# Altium project CountsFitness.PrjPCB (part 3 of 3)

## Sheet Connector_Section.SchDoc
size A4; DocumentNumber: 6; SheetNumber: 6; SheetTotal: 6
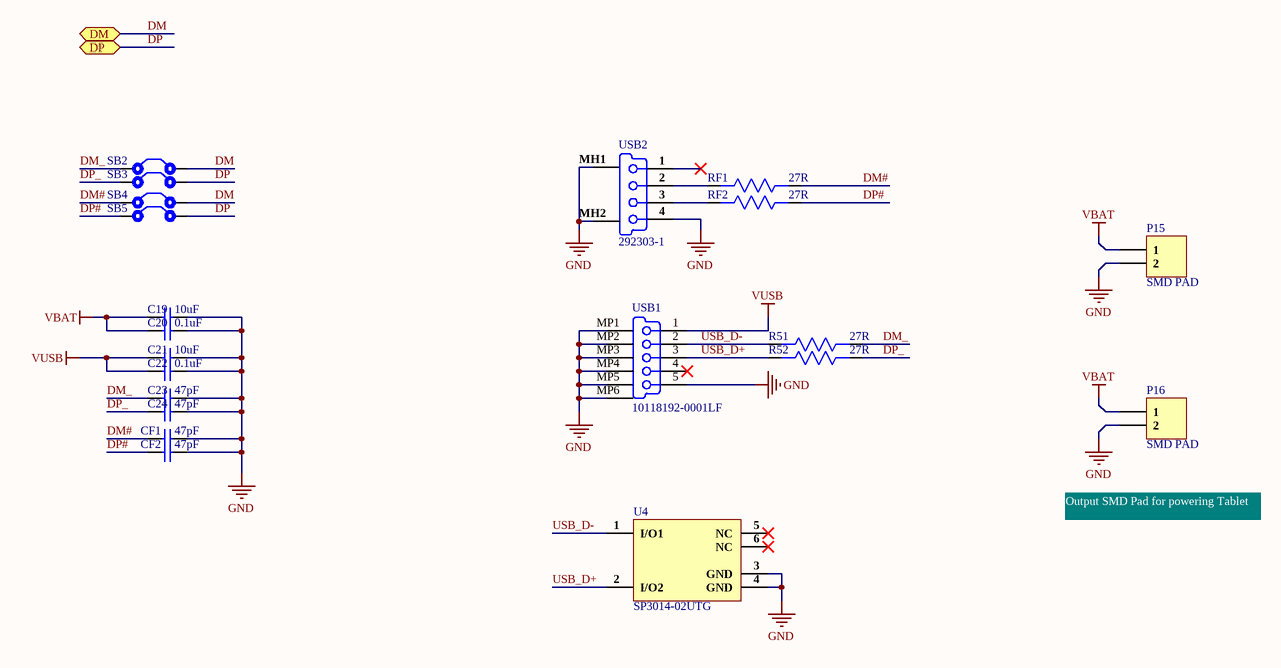
[diagram p4: Connector_Section.SchDoc]

### Parts
C19  10uF  [Cap0402]
C20  0.1uF  [Cap0402]
C21  10uF  [Cap0402]
C22  0.1uF  [Cap0402]
C23  47pF  [Cap0402]
C24  47pF  [Cap0402]
CF1  47pF  [Cap0402]
CF2  47pF  [Cap0402]
P15  SMD PAD  [Solder Bridge]
P16  SMD PAD  [Solder Bridge]
R51  27R  [Res0402]
R52  27R  [Res0402]
RF1  27R  [Res0402]
RF2  27R  [Res0402]
SB2  Solder Bridge  [Solder Bridge]  (value not drawn)
SB3  Solder Bridge  [Solder Bridge]  (value not drawn)
SB4  Solder Bridge  [Solder Bridge]  (value not drawn)
SB5  Solder Bridge  [Solder Bridge]  (value not drawn)
U4  SP3014-02UTG  [SP3014-02UTG]
USB1  10118192-0001LF  [Micro Usb Conn SMD]
USB2  292303-1  [292303-1]

### Ports
DM (bidir), DP (bidir)

### Nets
GND: C19.2 C20.2 C21.2 C22.2 C23.2 C24.2 CF1.2 CF2.2 P15.2 P16.2 U4.3(GND) U4.4(GND) USB1.5(GND) USB1.MP1(Tab) USB1.MP2(Tab) USB1.MP3(Tab) USB1.MP4(Tab) USB1.MP5(Tab) USB1.MP6(Tab) USB2.4(NC) USB2.MH1(Tab) USB2.MH2(Tab)
VBAT: C19.1 C20.1 P15.1 P16.1
VUSB: C21.1 C22.1 USB1.1(V_BUS_(5V))
DM: SB2.2 SB4.2 ; port DM
DM#: CF1.1 RF1.1 SB4.1
DM_: C23.1 R51.1 SB2.1
DP: SB3.2 SB5.2 ; port DP
DP#: CF2.1 RF2.1 SB5.1
DP_: C24.1 R52.1 SB3.1
USB_D+: R52.2 U4.2(I/O2) USB1.3(D+)
USB_D-: R51.2 U4.1(I/O1) USB1.2(D-)
NetRF1_2: RF1.2 USB2.2(D-)
NetRF2_2: RF2.2 USB2.3(D+)

Not connected (* = marked no-connect by the designer): U4 5(NC)* 6(NC)*; USB1 4(NC)*; USB2 1(V_BUS_(5V))*

### Notes on the sheet
- Output SMD Pad for powering Tablet

### Library data of the parts
C19 C21 = CL05A106MP8NUB8: CAP CER 10UF 10V X5R 0402; Manufacturer: Samsung; Tolerance: 20%; Supplier 1: Digi-Key; Manufacturer Part Number: CL05A106MP8NUB8; Stock 1: 1792112; Pricing 1: 1=0.4, 10=0.278, 50=0.1948, 100=0.167, 500=0.12528, 1000=0.1058, 2500=0.10023 (USD); Mount: Surface Mount; Case/Package: 0402; Case Code (Metric): 1005; Case Code (Imperial): 0402; Min Operating Temperature: -55°C; Max Operating Temperature: 85°C; Packaging: Tape and Reel; Capacitance: 10uF; Voltage Rating: 10V; Length: 0.039inch; Width: 0.02inch; Thickness: 0.035inch; ComponentLink1URL: http://www.samsungsem.com/kr/support/product-search/mlcc/CL05A106MP8NUB8.jsp?src-supplier=Digi-Key; ComponentLink1Description: http://www.samsungsem.com/kr/support/product-search/mlcc/CL05A106MP8NUB8.jsp?src-supplier=Digi-Key; Supplier Part Number 1: 1276-6830-1-ND
C20 C22 = CC0402KRX7R7BB104: CAP CER 0.1UF 16V X7R 0402; Manufacturer: Yageo; Tolerance: 10%; Capacitance: 100nF; Supplier 1: Digi-Key; Manufacturer Part Number: CC0402KRX7R7BB104; Stock 1: 16982736; Pricing 1: 1=0.1, 10=0.034, 100=0.015, 500=0.0107, 1000=0.00841, 2500=0.00764, 5000=0.00703 (USD); Mount: Surface Mount; Case/Package: 0402; Number of Pins: 2; Case Code (Metric): 1005; Case Code (Imperial): 0402; Min Operating Temperature: -55°C; Max Operating Temperature: 125°C; Dielectric: X7R; Voltage Rating: 16V; Voltage Rating (DC): 16V; Packaging: Tape and Reel; Package Quantity: 1; Termination: SMD/SMT; Composition: Ceramic; Voltage: 16V; Length: 1mm; Height: 0.5mm; Width: 0.02inch; Thickness: 0.022inch; Depth: 0.5mm; Radiation Hardening: No; REACH SVHC: No SVHC; Lead Free: Lead Free; Halogen Free: Halogen Free; ComponentLink1URL: http://www.yageo.com/documents/recent/UPY-GPHC_X7R_6.3V-to-50V_8.pdf?src-supplier=Avnet+Europe; ComponentLink1Description: http://www.yageo.com/documents/recent/UPY-GPHC_X7R_6.3V-to-50V_8.pdf?src-supplier=Avnet+Europe; ComponentLink2URL: http://www.yageo.com/documents/recent/UPY-GPHC_X7R_6.3V-to-50V_18.pdf?src-supplier=Digi-Key; ComponentLink2Description: http://www.yageo.com/documents/recent/UPY-GPHC_X7R_6.3V-to-50V_18.pdf?src-supplier=Digi-Key; ComponentLink3URL: http://www.yageo.com/documents/recent/UPY-GPHC_X7R_6.3V-to-50V_8.pdf?src-supplier=Avnet; ComponentLink3Description: http://www.yageo.com/documents/recent/UPY-GPHC_X7R_6.3V-to-50V_8.pdf?src-supplier=Avnet; ComponentLink4URL: http://www.yageo.com/documents/recent/UPY-GPHC_X7R_6.3V-to-50V_18.pdf?src-supplier=Mouser; ComponentLink4Description: http://www.yageo.com/documents/recent/UPY-GPHC_X7R_6.3V-to-50V_18.pdf?src-supplier=Mouser; ComponentLink5URL: http://www.farnell.com/datasheets/2167236.pdf?src-supplier=Element14; ComponentLink5Description: http://www.farnell.com/datasheets/2167236.pdf?src-supplier=Element14; ComponentLink6URL: http://www.farnell.com/datasheets/1489800.pdf?src-supplier=Element14; ComponentLink6Description: http://www.farnell.com/datasheets/1489800.pdf?src-supplier=Element14; Supplier Part Number 1: 311-1338-1-ND
C23 C24 CF1 CF2 = GCM1555C1H470JA16D: CAP CER 47PF 50V C0G/NP0 0402; Manufacturer: Murata; Tolerance: 5%; Supplier 1: Digi-Key; Manufacturer Part Number: GCM1555C1H470JA16D; Stock 1: 692165; Pricing 1: 1=0.1, 10=0.059, 50=0.0324, 100=0.0265, 500=0.01892, 1000=0.01487, 2500=0.01352, 5000=0.01244 (USD); Mount: Surface Mount; Case/Package: 0402; Case Code (Metric): 1005; Case Code (Imperial): 0402; Min Operating Temperature: -55°C; Max Operating Temperature: 125°C; Packaging: Cut Tape; Capacitance: 47pF; Voltage Rating: 50V; Length: 0.039inch; Width: 0.02inch; Thickness: 0.022inch; Ratings: AEC-Q200; Lead Free: Lead Free; ComponentLink1URL: https://www.murata.com/~/media/webrenewal/support/library/catalog/products/capacitor/mlcc/c03e.ashx?la=en-us&src-supplier=Digi-Key; ComponentLink1Description: https://www.murata.com/~/media/webrenewal/support/library/catalog/products/capacitor/mlcc/c03e.ashx?la=en-us&src-supplier=Digi-Key; ComponentLink2URL: http://www.mouser.com/ds/2/281/c03e-806517.pdf?src-supplier=Mouser; ComponentLink2Description: http://www.mouser.com/ds/2/281/c03e-806517.pdf?src-supplier=Mouser; ComponentLink3URL: http://psearch.en.murata.com/capacitor/product/GCM1555C1H470JA16%23.pdf?src-supplier=Avnet; ComponentLink3Description: http://psearch.en.murata.com/capacitor/product/GCM1555C1H470JA16%23.pdf?src-supplier=Avnet; Supplier Part Number 1: 490-10670-1-ND
P15 P16 = SMD PAD: Wire connecting Pads
R51 R52 RF1 RF2 = RT0402FRE0727RL: RES SMD 27 OHM 1% 1/16W 0402; Manufacturer: Yageo; Power Rating: 62.5mW; Voltage Rating: 50V; Max Power Dissipation: 63mW; Temperature Coefficient: 50ppm/°C; Supplier 1: Digi-Key; Manufacturer Part Number 1: RT0402FRE0727RL; Stock 1: 26946; Pricing 1: 1=0.1, 10=0.072, 100=0.0277, 1000=0.0122, 2500=0.0105, 5000=0.0094 (USD); Case/Package: 0402; Case Code (Metric): 1005; Case Code (Imperial): 0402; Min Operating Temperature: -55°C; Max Operating Temperature: 125°C; Resistance: 27R; Tolerance: 1%; Packaging: Tape and Reel; Package Quantity: 10000; Composition: Thin Film; Number of Terminations: 2; Termination: SMD/SMT; Military Standard: Not; Voltage Rating (DC): 50V; Features: Moisture Resistant; Length: 1mm; Height: 0.014inch; Width: 0.02inch; Depth: 0.5mm; Lead Free: Lead Free; ComponentLink1URL: http://www.yageo.com/NewPortal/yageodocoutput?fileName=/pdf/R-Chip/PYu-RT_1-to-0.05_RoHS_L_5.pdf&src-supplier=Digi-Key; ComponentLink1Description: http://www.yageo.com/NewPortal/yageodocoutput?fileName=/pdf/R-Chip/PYu-RT_1-to-0.05_RoHS_L_5.pdf&src-supplier=Digi-Key; ComponentLink2URL: http://www.mouser.com/ds/2/447/yageodocoutput-1125656.pdf?src-supplier=Mouser; ComponentLink2Description: http://www.mouser.com/ds/2/447/yageodocoutput-1125656.pdf?src-supplier=Mouser; Supplier Part Number 1: YAG3343CT-ND
SB2-SB5 = Solder Bridge: Solder Bridge ON
U4 = SP3014-02UTG: TVS DIODE 5V 6.8V 6UDFN; Manufacturer: Littelfuse; Capacitance: 1E-12F; Number of Bidirectional Channels: 2; Power Line Protection: Yes; Polarity: Unidirectional; Max Surge Current: 8A; Supplier 1: Digi-Key; Manufacturer Part Number: SP3014-02UTG; Stock 1: 3888; Pricing 1: 1=0.56, 10=0.495, 25=0.4652, 100=0.3375, 250=0.32552, 500=0.282, 1000=0.24 (USD); Mount: Surface Mount; Number of Pins: 6; Min Operating Temperature: -40°C; Max Operating Temperature: 125°C; Packaging: Tape and Reel; Reverse Standoff Voltage: 5V; Clamping Voltage: 6.8V; Termination: SMD/SMT; Number of Channels: 2; Working Voltage: 5V; Package Quantity: 3000; Peak Pulse Current: 8A; Length: 1.65mm; Height: 0.55mm; Width: 1.05mm; ComponentLink1URL: http://www.mouser.com/ds/2/240/Littelfuse_TVS_Diode_Array_SP3014_Datasheet.pdf-364113.pdf?src-supplier=Mouser; ComponentLink1Description: http://www.mouser.com/ds/2/240/Littelfuse_TVS_Diode_Array_SP3014_Datasheet.pdf-364113.pdf?src-supplier=Mouser; ComponentLink2URL: https://www.littelfuse.com/~/media/electronics/datasheets/tvs_diode_arrays/littelfuse_tvs_diode_array_sp3014_datasheet.pdf.pdf?src-supplier=Digi-Key; ComponentLink2Description: https://www.littelfuse.com/~/media/electronics/datasheets/tvs_diode_arrays/littelfuse_tvs_diode_array_sp3014_datasheet.pdf.pdf?src-supplier=Digi-Key; ComponentLink3URL: http://www.littelfuse.com/~/media/electronics/datasheets/tvs_diode_arrays/littelfuse_tvs_diode_array_sp3014_datasheet.pdf.pdf?src-supplier=Digi-Key; ComponentLink3Description: http://www.littelfuse.com/~/media/electronics/datasheets/tvs_diode_arrays/littelfuse_tvs_diode_array_sp3014_datasheet.pdf.pdf?src-supplier=Digi-Key; ComponentLink4URL: http://www.farnell.com/datasheets/2291833.pdf?src-supplier=Element14; ComponentLink4Description: http://www.farnell.com/datasheets/2291833.pdf?src-supplier=Element14; ComponentLink5URL: http://www.farnell.com/datasheets/2291833.pdf?src-supplier=Farnell; ComponentLink5Description: http://www.farnell.com/datasheets/2291833.pdf?src-supplier=Farnell; ComponentLink6URL: http://www.farnell.com/datasheets/2291833.pdf?src-supplier=Newark; ComponentLink6Description: http://www.farnell.com/datasheets/2291833.pdf?src-supplier=Newark; Supplier Part Number 1: F6501DKR-ND
USB1 = 10118192-0001LF: CONN USB MICRO B RECPT SMT R/A; Manufacturer: Amphenol FCI; Gender: Receptacle; Current Rating: 1.8A; Connector Type: USB,Receptacle; Number of Contacts: 5; Insulation Resistance: 1GR; Number of Ports: 1; Max Voltage Rating (AC): 100V; USB Standard: USB 2.0; Pitch: 0.65mm; Supplier 1: Digi-Key; Manufacturer Part Number: 10118192-0001LF; Stock 1: 203283; Pricing 1: 1=0.42, 10=0.393, 25=0.3536, 50=0.3144, 100=0.3013, 250=0.2751, 500=0.262 (USD); Mount: Surface Mount,Horizontal; Contact Material: Copper Alloy; Contact Plating: Nickel,Gold; Colour: Black; Number of Terminals: 5; Housing Material: Polymer; Min Operating Temperature: -55°C; Max Operating Temperature: 85°C; Termination: Solder; Orientation: Right Angle; Packaging: Tape and Reel; Package Quantity: 1400; Voltage Rating: 100V; Length: 7.86mm; Depth: 5.57mm; Radiation Hardening: No; Lead Free: Lead Free; Flammability Rating: UL94 V-0; REACH SVHC: No SVHC; ComponentLink1URL: https://datasheet.ciiva.com/26853/getdatasheetpartid-418041-26853891.pdf; ComponentLink1Description: https://datasheet.ciiva.com/26853/getdatasheetpartid-418041-26853891.pdf; ComponentLink2URL: https://datasheet.ciiva.com/851/10118192-851112.pdf; ComponentLink2Description: https://datasheet.ciiva.com/851/10118192-851112.pdf; ComponentLink3URL: https://datasheet.ciiva.com/4598/10118192ac-197249-4598796.pdf; ComponentLink3Description: https://datasheet.ciiva.com/4598/10118192ac-197249-4598796.pdf; Supplier Part Number 1: 609-4613-1-ND
USB2 = 292303-1: USB-A (USB TYPE-A) USB 2.0 Receptacle Connector 4 Position Through Hole, Right Angle; Manufacturer: TE Connectivity; Plating: Bright,Tin; Number of Positions: 4; Number of Ports: 1; Plating Thickness: 0.76um; Contact Current Rating: 1A; Circuit Application: Signal; Connector System: Cable-to-Board; USB Standard: USB 2.0; Insulation Resistance: 1GR; Voltage Rating (AC): 30V; Pitch: 2.5mm; PCB Thickness: 0.062inch; Tail Length: 0.112inch; Approvals: UL; Supplier 1: Digi-Key; Manufacturer Part Number: 292303-1; Stock 1: 19088; Pricing 1: 1=1.49, 10=1.354, 25=1.2716, 50=1.2162, 100=1.161, 250=1.0504, 500=0.96748, 1000=0.82926, 2500=0.77398 (USD); Mount: Through Hole,Horizontal; Contact Plating: Gold; Housing Material: Thermoplastic; Housing Color: Black; Contact Material: Copper Alloy,Copper; Number of Terminals: 4; Color: Black; Min Operating Temperature: -67°C; Max Operating Temperature: 185°C; Packaging: Rail/Tube; Package Quantity: 30; Termination: Through Hole; Gender: Receptacle; Connector Type: Receptacle; Orientation: Right Angle; Number of Contacts: 4; Current Rating: 1A; Length: 14.63mm; Depth: 14mm; REACH SVHC: No SVHC; Flammability Rating: UL94 V-0; Halogen Free: Halogen Free; ComponentLink1URL: http://www.farnell.com/datasheets/1699414.pdf?src-supplier=Farnell; ComponentLink1Description: http://www.farnell.com/datasheets/1699414.pdf?src-supplier=Farnell; ComponentLink2URL: http://www.te.com/commerce/DocumentDelivery/DDEController?Action=showdoc&DocId=Data+Sheet%7F1-1773453-6%7F0908%7Fpdf%7FEnglish%7FENG_DS_1-1773453-6_0908.pdf&src-supplier=Avnet; ComponentLink2Description: http://www.te.com/commerce/DocumentDelivery/DDEController?Action=showdoc&DocId=Data+Sheet%7F1-1773453-6%7F0908%7Fpdf%7FEnglish%7FENG_DS_1-1773453-6_0908.pdf&src-supplier=Avnet; ComponentLink3URL: http://www.te.com/commerce/DocumentDelivery/DDEController?Action=showdoc&DocId=Data+Sheet1-1773453-60908pdfEnglishENG_DS_1-1773453-6_0908.pdf&src-supplier=Avnet+Asia; ComponentLink3Description: http://www.te.com/commerce/DocumentDelivery/DDEController?Action=showdoc&DocId=Data+Sheet1-1773453-60908pdfEnglishENG_DS_1-1773453-6_0908.pdf&src-supplier=Avnet+Asia; ComponentLink4URL: https://www.te.com/commerce/DocumentDelivery/DDEController?Action=srchrtrv&DocNm=292303&DocType=Customer+Drawing&DocLang=English&src-supplier=Digi-Key; ComponentLink4Description: https://www.te.com/commerce/DocumentDelivery/DDEController?Action=srchrtrv&DocNm=292303&DocType=Customer+Drawing&DocLang=English&src-supplier=Digi-Key; ComponentLink5URL: http://www.farnell.com/datasheets/1699414.pdf?src-supplier=Element14; ComponentLink5Description: http://www.farnell.com/datasheets/1699414.pdf?src-supplier=Element14; ComponentLink6URL: http://www.farnell.com/cad/1699210.pdf?src-supplier=Element14; ComponentLink6Description: http://www.farnell.com/cad/1699210.pdf?src-supplier=Element14; ComponentLink7URL: https://www.alliedelec.com/m/d/b8ff6cd1157c72c7c4c41b4704d2a2e6.pdf?src-supplier=Allied+Electronics; ComponentLink7Description: https://www.alliedelec.com/m/d/b8ff6cd1157c72c7c4c41b4704d2a2e6.pdf?src-supplier=Allied+Electronics; ComponentLink8URL: http://www.te.com/commerce/DocumentDelivery/DDEController?Action=showdoc&DocId=Data+Sheet%7F1-1773453-6%7F0908%7Fpdf%7FEnglish%7FENG_DS_1-1773453-6_0908.pdf&src-supplier=Avnet+Europe; ComponentLink8Description: http://www.te.com/commerce/DocumentDelivery/DDEController?Action=showdoc&DocId=Data+Sheet%7F1-1773453-6%7F0908%7Fpdf%7FEnglish%7FENG_DS_1-1773453-6_0908.pdf&src-supplier=Avnet+Europe; ComponentLink9URL: https://www.distrelec.biz/Web/Downloads/07/08/04270708.pdf?mime=application%2Fpdf&src-supplier=Distrelec; ComponentLink9Description: https://www.distrelec.biz/Web/Downloads/07/08/04270708.pdf?mime=application%2Fpdf&src-supplier=Distrelec; ComponentLink10URL: http://www.jameco.com/Jameco/Products/ProdDS/921651.pdf?src-supplier=Jameco; ComponentLink10Description: http://www.jameco.com/Jameco/Products/ProdDS/921651.pdf?src-supplier=Jameco; ComponentLink11URL: http://www.onlinecomponents.com/productFiles/mf-AMP/ddecontrolleractionsrchrtrvdocnm117734536doctypedsdoclan.pdf?src-supplier=Onlinecomponents.com; ComponentLink11Description: http://www.onlinecomponents.com/productFiles/mf-AMP/ddecontrolleractionsrchrtrvdocnm117734536doctypedsdoclan.pdf?src-supplier=Onlinecomponents.com; ComponentLink12URL: http://www.te.com/commerce/DocumentDelivery/DDEController?Action=showdoc&DocId=Customer+Drawing%7F292303%7FE7%7Fpdf%7FEnglish%7FENG_CD_292303_E7.pdf%7F292303-1&src-supplier=Future+Electronics; ComponentLink12Description: http://www.te.com/commerce/DocumentDelivery/DDEController?Action=showdoc&DocId=Customer+Drawing%7F292303%7FE7%7Fpdf%7FEnglish%7FENG_CD_292303_E7.pdf%7F292303-1&src-supplier=Future+Electronics; Supplier Part Number 1: A31726-ND

## Sheet Buttons_Section_2.SchDoc
size A4; DocumentNumber: 4; SheetNumber: 4; SheetTotal: 6
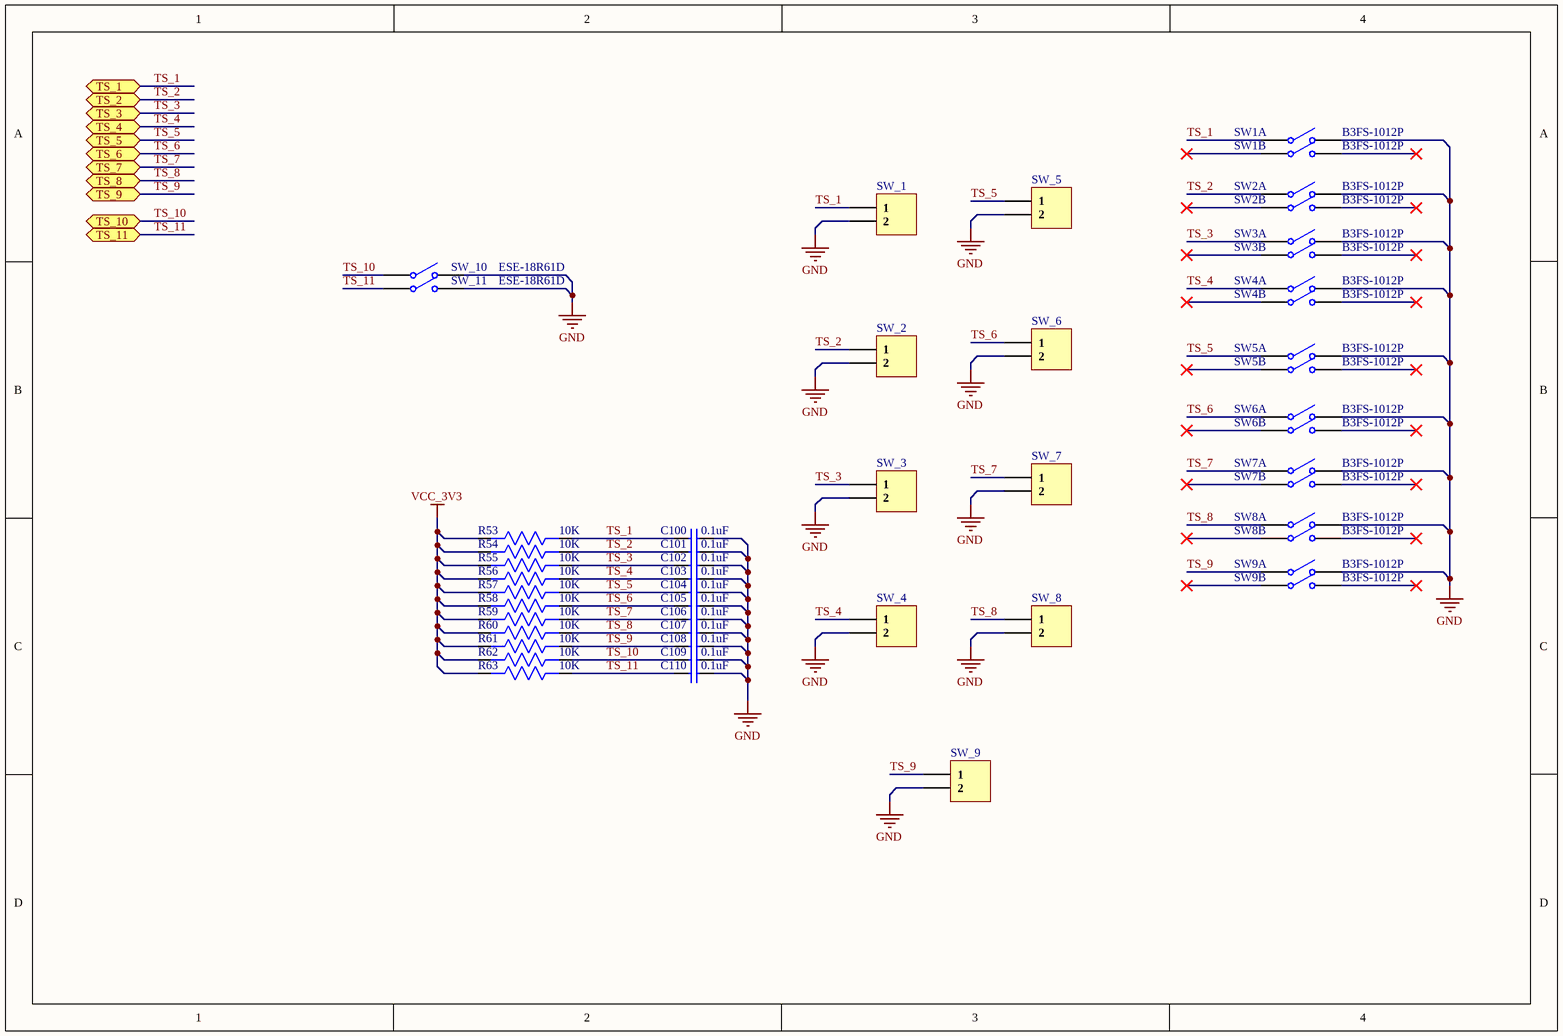
[diagram p5: Buttons_Section_2.SchDoc]

### Parts
C100  0.1uF  [Cap0402]
C101  0.1uF  [Cap0402]
C102  0.1uF  [Cap0402]
C103  0.1uF  [Cap0402]
C104  0.1uF  [Cap0402]
C105  0.1uF  [Cap0402]
C106  0.1uF  [Cap0402]
C107  0.1uF  [Cap0402]
C108  0.1uF  [Cap0402]
C109  0.1uF  [Cap0402]
C110  0.1uF  [Cap0402]
R53  10K  [Res0402]
R54  10K  [Res0402]
R55  10K  [Res0402]
R56  10K  [Res0402]
R57  10K  [Res0402]
R58  10K  [Res0402]
R59  10K  [Res0402]
R60  10K  [Res0402]
R61  10K  [Res0402]
R62  10K  [Res0402]
R63  10K  [Res0402]
SW1  B3FS-1012P  [B3FS-1012P]  (parts A,B of 2)
SW2  B3FS-1012P  [B3FS-1012P]  (parts A,B of 2)
SW3  B3FS-1012P  [B3FS-1012P]  (parts A,B of 2)
SW4  B3FS-1012P  [B3FS-1012P]  (parts A,B of 2)
SW5  B3FS-1012P  [B3FS-1012P]  (parts A,B of 2)
SW6  B3FS-1012P  [B3FS-1012P]  (parts A,B of 2)
SW7  B3FS-1012P  [B3FS-1012P]  (parts A,B of 2)
SW8  B3FS-1012P  [B3FS-1012P]  (parts A,B of 2)
SW9  B3FS-1012P  [B3FS-1012P]  (parts A,B of 2)
SW_1  61300211121  [HDR1X2]  (value not drawn)
SW_2  61300211121  [HDR1X2]  (value not drawn)
SW_3  61300211121  [HDR1X2]  (value not drawn)
SW_4  61300211121  [HDR1X2]  (value not drawn)
SW_5  61300211121  [HDR1X2]  (value not drawn)
SW_6  61300211121  [HDR1X2]  (value not drawn)
SW_7  61300211121  [HDR1X2]  (value not drawn)
SW_8  61300211121  [HDR1X2]  (value not drawn)
SW_9  61300211121  [HDR1X2]  (value not drawn)
SW_10  ESE-18R61D  [ESE-18R61D]
SW_11  ESE-18R61D  [ESE-18R61D]

### Ports
TS_1 (bidir), TS_2 (bidir), TS_3 (bidir), TS_4 (bidir), TS_5 (bidir), TS_6 (bidir), TS_7 (bidir), TS_8 (bidir), TS_9 (bidir), TS_10 (bidir), TS_11 (bidir)

### Nets
GND: C100.2 C101.2 C102.2 C103.2 C104.2 C105.2 C106.2 C107.2 C108.2 C109.2 C110.2 SW1.3 SW2.3 SW3.3 SW4.3 SW5.3 SW6.3 SW7.3 SW8.3 SW9.3 SW_1.2 SW_2.2 SW_3.2 SW_4.2 SW_5.2 SW_6.2 SW_7.2 SW_8.2 SW_9.2 SW_10.2 SW_11.2
VCC_3V3: R53.2 R54.2 R55.2 R56.2 R57.2 R58.2 R59.2 R60.2 R61.2 R62.2 R63.2
TS_1: C100.1 R53.1 SW1.1 SW_1.1 ; port TS_1
TS_2: C101.1 R54.1 SW2.1 SW_2.1 ; port TS_2
TS_3: C102.1 R55.1 SW3.1 SW_3.1 ; port TS_3
TS_4: C103.1 R56.1 SW4.1 SW_4.1 ; port TS_4
TS_5: C104.1 R57.1 SW5.1 SW_5.1 ; port TS_5
TS_6: C105.1 R58.1 SW6.1 SW_6.1 ; port TS_6
TS_7: C106.1 R59.1 SW7.1 SW_7.1 ; port TS_7
TS_8: C107.1 R60.1 SW8.1 SW_8.1 ; port TS_8
TS_9: C108.1 R61.1 SW9.1 SW_9.1 ; port TS_9
TS_10: C109.1 R62.1 SW_10.1 ; port TS_10
TS_11: C110.1 R63.1 SW_11.1 ; port TS_11

Not connected (* = marked no-connect by the designer): SW1 2* 4*; SW2 2* 4*; SW3 2* 4*; SW4 2* 4*; SW5 2* 4*; SW6 2* 4*; SW7 2* 4*; SW8 2* 4*; SW9 2* 4*

### Library data of the parts
C100-C110 = CC0402KRX7R7BB104: as C20 on sheet Connector_Section; Supplier 1: Digi-Key; Manufacturer Part Number: CC0402KRX7R7BB104; Stock 1: 16982736; Pricing 1: 1=0.1, 10=0.034, 100=0.015, 500=0.0107, 1000=0.00841, 2500=0.00764, 5000=0.00703 (USD); Mount: Surface Mount; Case/Package: 0402; Number of Pins: 2; Case Code (Metric): 1005; Case Code (Imperial): 0402; Min Operating Temperature: -55°C; Max Operating Temperature: 125°C; Dielectric: X7R; Voltage Rating: 16V; Voltage Rating (DC): 16V; Packaging: Tape and Reel; Package Quantity: 1; Termination: SMD/SMT; Composition: Ceramic; Voltage: 16V; Length: 1mm; Height: 0.5mm; Width: 0.02inch; Thickness: 0.022inch; Depth: 0.5mm; Radiation Hardening: No; REACH SVHC: No SVHC; Lead Free: Lead Free; Halogen Free: Halogen Free; ComponentLink1URL: http://www.yageo.com/documents/recent/UPY-GPHC_X7R_6.3V-to-50V_8.pdf?src-supplier=Avnet+Europe; ComponentLink1Description: http://www.yageo.com/documents/recent/UPY-GPHC_X7R_6.3V-to-50V_8.pdf?src-supplier=Avnet+Europe; ComponentLink2URL: http://www.yageo.com/documents/recent/UPY-GPHC_X7R_6.3V-to-50V_18.pdf?src-supplier=Digi-Key; ComponentLink2Description: http://www.yageo.com/documents/recent/UPY-GPHC_X7R_6.3V-to-50V_18.pdf?src-supplier=Digi-Key; ComponentLink3URL: http://www.yageo.com/documents/recent/UPY-GPHC_X7R_6.3V-to-50V_8.pdf?src-supplier=Avnet; ComponentLink3Description: http://www.yageo.com/documents/recent/UPY-GPHC_X7R_6.3V-to-50V_8.pdf?src-supplier=Avnet; ComponentLink4URL: http://www.yageo.com/documents/recent/UPY-GPHC_X7R_6.3V-to-50V_18.pdf?src-supplier=Mouser; ComponentLink4Description: http://www.yageo.com/documents/recent/UPY-GPHC_X7R_6.3V-to-50V_18.pdf?src-supplier=Mouser; ComponentLink5URL: http://www.farnell.com/datasheets/2167236.pdf?src-supplier=Element14; ComponentLink5Description: http://www.farnell.com/datasheets/2167236.pdf?src-supplier=Element14; ComponentLink6URL: http://www.farnell.com/datasheets/1489800.pdf?src-supplier=Element14; ComponentLink6Description: http://www.farnell.com/datasheets/1489800.pdf?src-supplier=Element14; Supplier Part Number 1: 311-1338-1-ND
R53-R63 = RK73B1ETTP103J: RES 10K OHM 5% 1/10W 0402; Manufacturer: KOA Speer; Resistance: 10kR; Power Rating: 63mW; Voltage Rating: 50V; Temperature Coefficient: 200ppm/°C; Supplier 1: Digi-Key; Manufacturer Part Number: RK73B1ETTP103J; Stock 1: 2917894; Pricing 1: 1=0.1, 10=0.016, 100=0.0065, 1000=0.00292, 2500=0.00253, 5000=0.00209 (USD); Mount: Surface Mount; Case/Package: 0402; Case Code (Imperial): 0402; Case Code (Metric): 1005; Min Operating Temperature: -55°C; Max Operating Temperature: 155°C; Packaging: Tape and Reel; Tolerance: 5%; Package Quantity: 10000; Composition: Thick Film; Termination: SMD/SMT; Military Standard: Not; Voltage Rating (DC): 50V; Length: 1mm; Height: 0.35mm; Width: 0.5mm; Depth: 0.5mm; Lead Free: Lead Free; ComponentLink1URL: https://www.verical.com/server-webapp/html/getDatasheet?partID=89073&src-supplier=Verical; ComponentLink1Description: https://www.verical.com/server-webapp/html/getDatasheet?partID=89073&src-supplier=Verical; Supplier Part Number 1: 2019-RK73B1ETTP103JCT-ND
SW1-SW9 = B3FS-1012P: SWITCH TACTILE SPST-NO 0.05A 24V; Manufacturer: Omron; Mechanical Life: 300000Cycles; Throw Configuration: SPST; Contact Resistance: 100mR; Operating Force: 1.47N; Current Rating: 50mA; Illumination Type: Non-Illuminated; Switch Travel: 0.25mm; Switch Function: Off-Mom; Actuator Type: Standard; Actuator Length: 1.7mm; Supplier 1: Digi-Key; Manufacturer Part Number: B3FS-1012P; Stock 1: 177804; Pricing 1: 1=0.59, 10=0.569, 25=0.548, 100=0.4741, 250=0.43192, 500=0.40034 (USD); Mount: Surface Mount; Case/Package: SMD/SMT; Weight: 0.2g; Contact Plating: Silver; Min Operating Temperature: -20°C; Max Operating Temperature: 70°C; Voltage Rating (DC): 24V; Packaging: Tape and Reel; Max Voltage Rating (DC): 24V; Package Quantity: 1; Max Current Rating: 50mA; Termination: Gull Wing; Electrical Life: 300000Cycles; Orientation: Straight; Length: 6.3mm; Depth: 8mm; Radiation Hardening: No; ComponentLink1URL: https://omronfs.omron.com/en_US/ecb/products/pdf/en-b3fs.pdf?src-supplier=Digi-Key; ComponentLink1Description: https://omronfs.omron.com/en_US/ecb/products/pdf/en-b3fs.pdf?src-supplier=Digi-Key; ComponentLink2URL: http://omronfs.omron.com/en_US/ecb/products/pdf/en-b3fs.pdf?src-supplier=Digi-Key; ComponentLink2Description: http://omronfs.omron.com/en_US/ecb/products/pdf/en-b3fs.pdf?src-supplier=Digi-Key; Supplier Part Number 1: SW1237CT-ND
SW_1-SW_9 = Header 1x2: CONN HEADER VERT 2POS 2.54MM; Manufacturer: Wurth Electronics; Current Rating: 3A; Voltage Rating: 250V; Number of Positions: 2; Gender: Male; Connector Type: Male Pin; Pitch: 0.1inch; Supplier 1: Digi-Key; Manufacturer Part Number: 61300211121; Stock 1: 219205; Pricing 1: 1=0.13, 10=0.106, 25=0.088, 50=0.074, 100=0.067, 1000=0.061 (USD); Mount: Through Hole; Contact Plating: Gold; Housing Material: PBT; Contact Material: Copper Alloy,Copper; Color: Black; Min Operating Temperature: -40°C; Max Operating Temperature: 125°C; Number of Rows: 1; Contact Gender: Male; Packaging: Bulk; Termination: Through Hole; Number of Contacts: 2; Contact Mating Length: 0.236inch; REACH SVHC: Unknown; Lead Free: Lead Free; ComponentLink1URL: http://www.mouser.com/ds/2/445/6130xx11121-538006.pdf?src-supplier=Mouser; ComponentLink1Description: http://www.mouser.com/ds/2/445/6130xx11121-538006.pdf?src-supplier=Mouser; Supplier Part Number 1: 732-5315-ND
SW_10 SW_11 = ESE-18R61D: SWITCH DETECTOR SPST-NC 10MA 5V; Manufacturer: Panasonic; Mechanical Life: 50000Cycles; Throw Configuration: SPST; Contact Resistance: 500mR; Operating Force: 0.3N; Operating Position: 0.102inch; Switch Function: On-Mom; Actuator Type: Lever; Actuator Length: 2.15mm; Supplier 1: Digi-Key; Manufacturer Part Number: ESE-18R61D; Stock 1: 39873; Pricing 1: 1=1, 10=0.962, 25=0.8992, 100=0.7807, 250=0.7104, 500=0.6586, 1000=0.6105, 2500=0.555 (USD); Mount: Surface Mount; Number of Terminals: 2; Min Operating Temperature: -10°C; Max Operating Temperature: 60°C; Voltage Rating (DC): 5V; Packaging: Tape and Reel; Max Voltage Rating (DC): 5V; Package Quantity: 1; Contact Current Rating: 10mA; Current Rating: 10mA; Termination: SMD/SMT; Electrical Life: 50000Cycles; Orientation: Right Angle; Height: 1.2mm; Width: 4mm; REACH SVHC: No SVHC; Lead Free: Lead Free; ComponentLink1URL: https://industrial.panasonic.com/cdbs/www-data/pdf/ATB0000/ATB0000C8.pdf?src-supplier=Digi-Key; ComponentLink1Description: https://industrial.panasonic.com/cdbs/www-data/pdf/ATB0000/ATB0000C8.pdf?src-supplier=Digi-Key; ComponentLink2URL: http://www.farnell.com/datasheets/1520574.pdf?src-supplier=Newark; ComponentLink2Description: http://www.farnell.com/datasheets/1520574.pdf?src-supplier=Newark; ComponentLink3URL: https://www.distrelec.biz/Web/Downloads/_t/ds/ese18_eng_tds.pdf?mime=application%2Fpdf&src-supplier=Distrelec; ComponentLink3Description: https://www.distrelec.biz/Web/Downloads/_t/ds/ese18_eng_tds.pdf?mime=application%2Fpdf&src-supplier=Distrelec; ComponentLink4URL: http://www.farnell.com/datasheets/1728953.pdf?src-supplier=Element14; ComponentLink4Description: http://www.farnell.com/datasheets/1728953.pdf?src-supplier=Element14; Supplier Part Number 1: P13373SCT-ND

## Nets that join several sheets
GND: Power_Section (14 pins), Controller_Section (19 pins), Buttons_Section (40 pins), Connector_Section (22 pins), Buttons_Section_2 (31 pins)
VBAT: Power_Section (C2.1 Q1.3 R6.2 SB6.2), Connector_Section (C19.1 C20.1 P15.1 P16.1)
VCC_3V3: Power_Section (6 pins), Controller_Section (14 pins), Buttons_Section (20 pins), Buttons_Section_2 (11 pins)
VUSB: Power_Section (6 pins), Connector_Section (C21.1 C22.1 USB1.1)
ACT1: Controller_Section (U1.10), Buttons_Section (C111.1 P1.4 R11.1)
ACT2: Controller_Section (U1.11), Buttons_Section (C112.1 P3.4 R13.1)
ACT3: Controller_Section (U1.12), Buttons_Section (C113.1 P5.4 R15.1)
ACT4: Controller_Section (U1.13), Buttons_Section (C114.1 P7.4 R17.1)
ACT5: Controller_Section (U1.14), Buttons_Section (C115.1 P2.4 R19.1)
ACT6: Controller_Section (U1.15), Buttons_Section (C116.1 P4.4 R21.1)
ACT7: Controller_Section (U1.16), Buttons_Section (C117.1 P6.4 R23.1)
ACT8: Controller_Section (U1.17), Buttons_Section (C118.1 P8.4 R25.1)
ACT9: Controller_Section (U1.29), Buttons_Section (C119.1 P9.4 R27.1)
ACT10: Controller_Section (U1.30), Buttons_Section (C120.1 P10.4 R29.1)
DM: Controller_Section (U1.32), Connector_Section (SB2.2 SB4.2)
DP: Controller_Section (U1.33), Connector_Section (SB3.2 SB5.2)
LCTRL1: Controller_Section (U1.18), Buttons_Section (R31.1)
LCTRL2: Controller_Section (U1.19), Buttons_Section (R35.1)
LCTRL3: Controller_Section (U1.20), Buttons_Section (R39.1)
LCTRL4: Controller_Section (U1.39), Buttons_Section (R43.1)
LCTRL5: Controller_Section (U1.40), Buttons_Section (R47.1)
LCTRL6: Controller_Section (U1.41), Buttons_Section (R33.1)
LCTRL7: Controller_Section (U1.42), Buttons_Section (R37.1)
LCTRL8: Controller_Section (U1.43), Buttons_Section (R41.1)
LCTRL9: Controller_Section (U1.45), Buttons_Section (R45.1)
LCTRL10: Controller_Section (U1.46), Buttons_Section (R49.1)
TS_1: Controller_Section (U1.21), Buttons_Section_2 (C100.1 R53.1 SW1.1 SW_1.1)
TS_2: Controller_Section (U1.22), Buttons_Section_2 (C101.1 R54.1 SW2.1 SW_2.1)
TS_3: Controller_Section (U1.25), Buttons_Section_2 (C102.1 R55.1 SW3.1 SW_3.1)
TS_4: Controller_Section (U1.26), Buttons_Section_2 (C103.1 R56.1 SW4.1 SW_4.1)
TS_5: Controller_Section (U1.27), Buttons_Section_2 (C104.1 R57.1 SW5.1 SW_5.1)
TS_6: Controller_Section (U1.28), Buttons_Section_2 (C105.1 R58.1 SW6.1 SW_6.1)
TS_7: Controller_Section (U1.34), Buttons_Section_2 (C106.1 R59.1 SW7.1 SW_7.1)
TS_8: Controller_Section (U1.37), Buttons_Section_2 (C107.1 R60.1 SW8.1 SW_8.1)
TS_9: Controller_Section (U1.38), Buttons_Section_2 (C108.1 R61.1 SW9.1 SW_9.1)
TS_10: Controller_Section (U1.3), Buttons_Section_2 (C109.1 R62.1 SW_10.1)
TS_11: Controller_Section (U1.4), Buttons_Section_2 (C110.1 R63.1 SW_11.1)